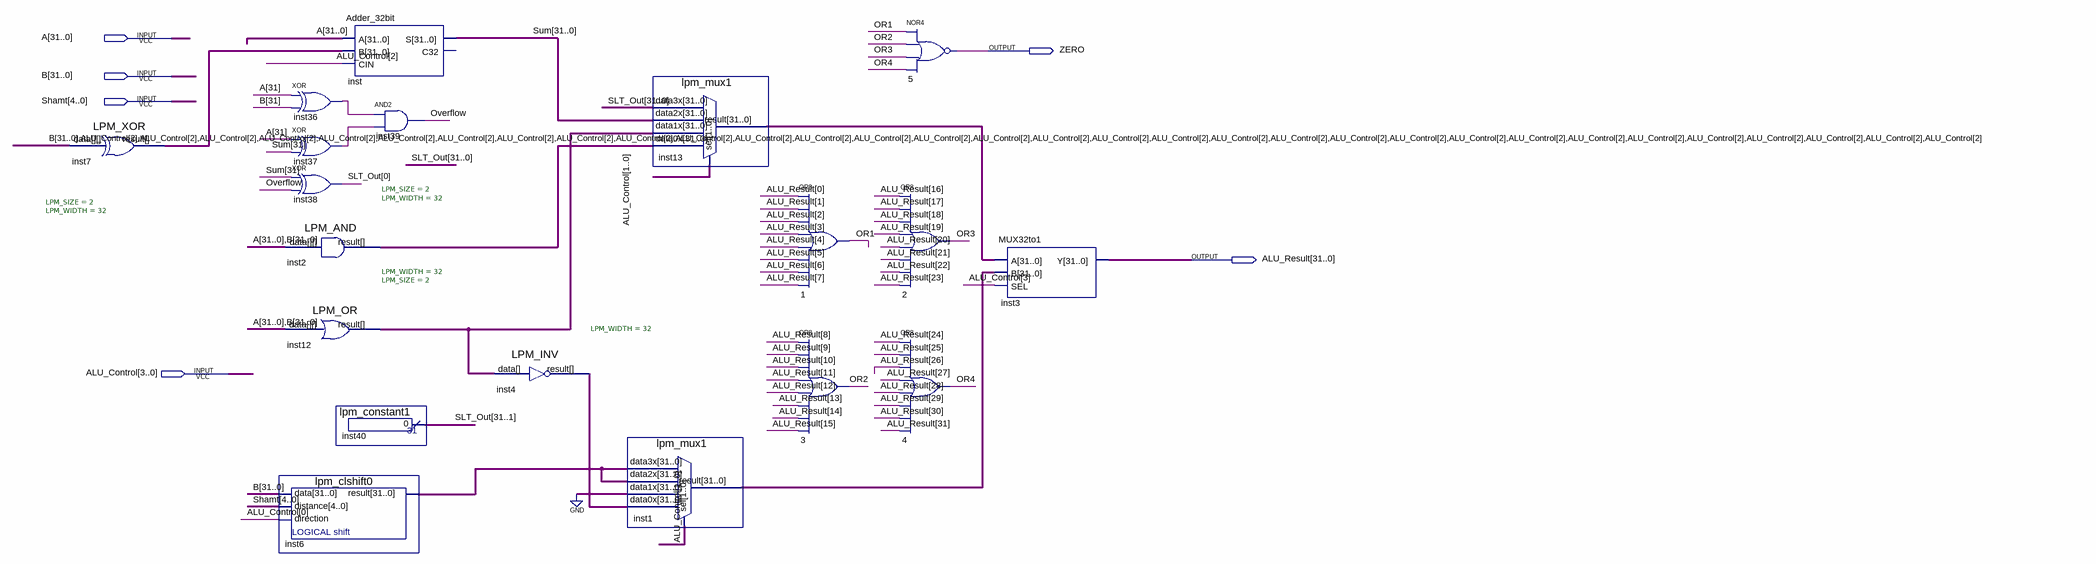
[diagram p0: schematic sheet]
// Quartus schematic ALU_32bit.bdf as structural Verilog: 19 symbols, 6 pins
module ALU_32bit (
  input  [31:0] A,
  input  [31:0] B,
  input  [4:0] Shamt,
  input  [3:0] ALU_Control,
  output ZERO,
  output [31:0] ALU_Result
);

  wire inst36_out, inst37_out, OR1, OR2, OR3, OR4, Overflow;
  wire [31:0] inst1_result, inst2_result, inst4_result, inst6_result, inst7_result, inst12_result,
       inst13_result, SLT_Out, Sum;

  LPM_XOR #(.LPM_SIZE(2), .LPM_WIDTH(32)) inst7 (.data({B, {32{ALU_Control[2]}}}), .result(inst7_result));
  xor inst36 (inst36_out, A[31], B[31]);
  xor inst37 (inst37_out, A[31], Sum[31]);
  xor inst38 (SLT_Out[0], Sum[31], Overflow);
  LPM_AND #(.LPM_SIZE(2), .LPM_WIDTH(32)) inst2 (.data({A, B}), .result(inst2_result));
  LPM_OR #(.LPM_WIDTH(32), .LPM_SIZE(2)) inst12 (.data({A, B}), .result(inst12_result));
  lpm_clshift0 inst6 (.data(B), .distance(Shamt), .direction(ALU_Control[0]), .result(inst6_result));
  Adder_32bit inst (.A(A), .B(inst7_result), .CIN(ALU_Control[2]), .S(Sum));  // open: C32
  lpm_constant1 inst40 (.result(SLT_Out[31:1]));
  and inst39 (Overflow, inst36_out, inst37_out);
  LPM_INV #(.LPM_WIDTH(32)) inst4 (.data(inst12_result), .result(inst4_result));
  lpm_mux1 inst13 (
    .data3x(SLT_Out), .data2x(Sum), .data1x(inst12_result), .data0x(inst2_result), .sel(ALU_Control[1:0]),
    .result(inst13_result));
  lpm_mux1 inst1 (
    .data3x(inst6_result), .data2x(inst6_result), .data1x({32{1'b0}}), .data0x(inst4_result),
    .sel(ALU_Control[1:0]), .result(inst1_result));
  or u_1 (OR1, ALU_Result[0], ALU_Result[1], ALU_Result[2], ALU_Result[3], ALU_Result[4], ALU_Result[5], ALU_Result[6], ALU_Result[7]);
  or u_3 (OR2, ALU_Result[8], ALU_Result[9], ALU_Result[10], ALU_Result[11], ALU_Result[12], ALU_Result[13], ALU_Result[14], ALU_Result[15]);
  nor u_5 (ZERO, OR1, OR2, OR3, OR4);
  or u_2 (OR3, ALU_Result[16], ALU_Result[17], ALU_Result[18], ALU_Result[19], ALU_Result[20], ALU_Result[21], ALU_Result[22], ALU_Result[23]);
  or u_4 (OR4, ALU_Result[24], ALU_Result[25], ALU_Result[26], ALU_Result[27], ALU_Result[28], ALU_Result[29], ALU_Result[30], ALU_Result[31]);
  MUX32to1 inst3 (.A(inst13_result), .B(inst1_result), .SEL(ALU_Control[3]), .Y(ALU_Result));
endmodule
